# Altium project Main_Board.PrjPcb (part 24 of 44)

## Sheet TPS7A88_5V_Dual_3.3V_3.3V.SchDoc
size A4
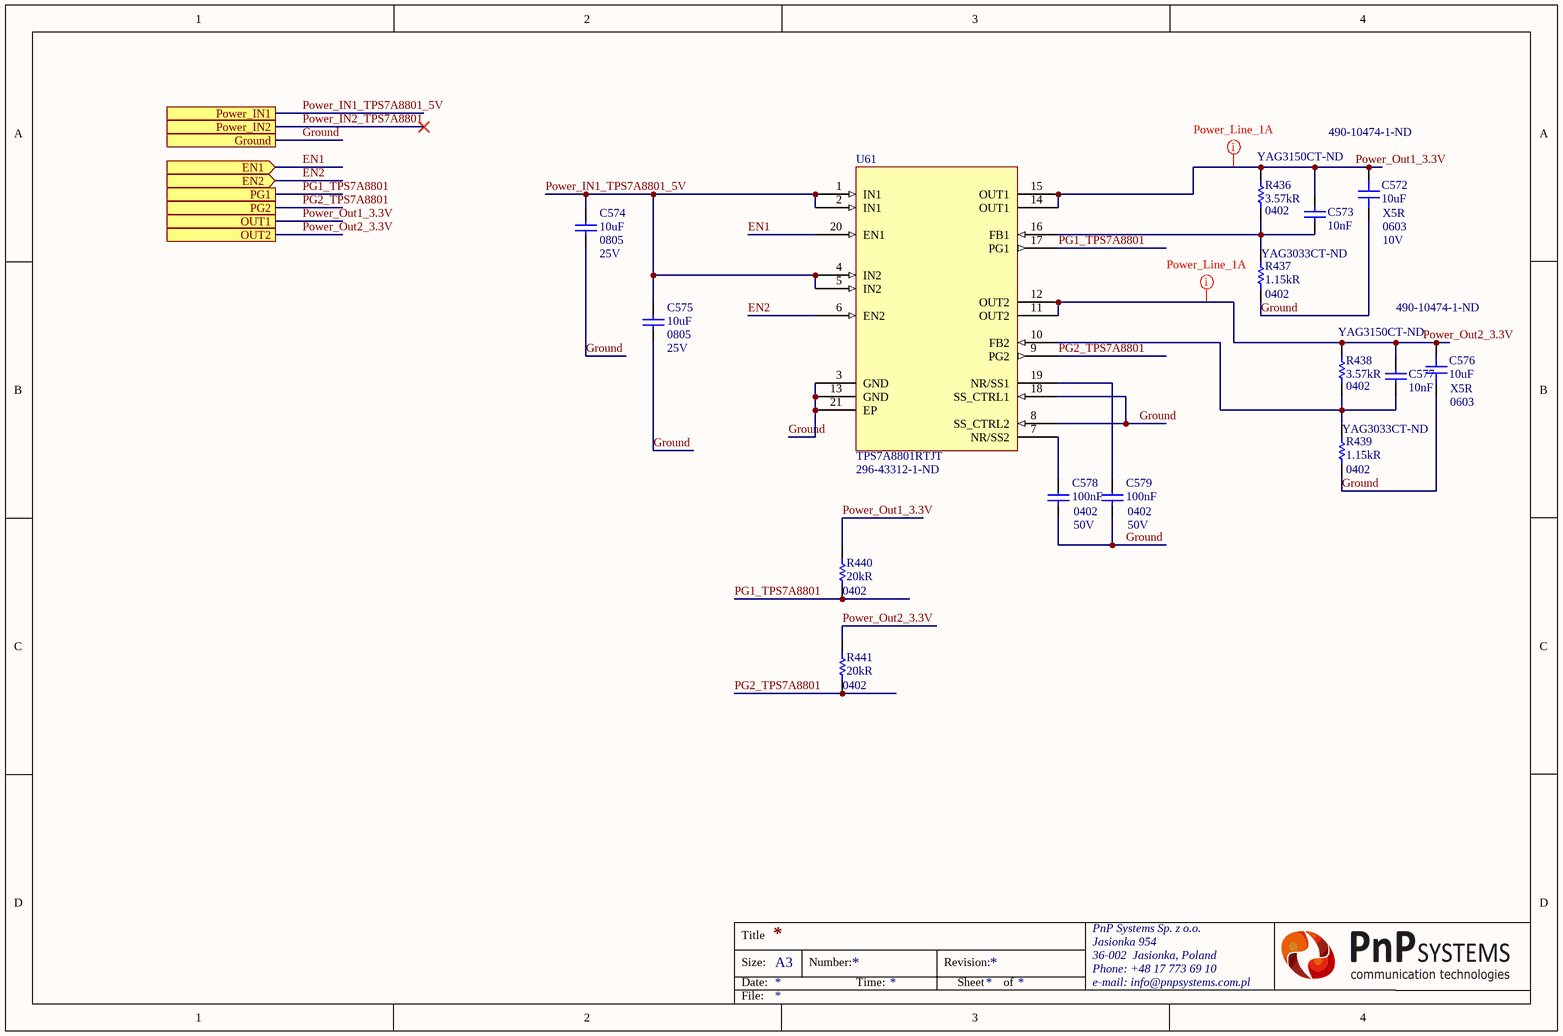
[diagram p32: TPS7A88_5V_Dual_3.3V_3.3V.SchDoc]

### Parts
C572  10uF  Supplier Part Number 1: 490-10474-1-ND  Case/Package: 0603  Dielectric: X5R  Voltage Rating: 10V  [CAP 0603/1608 RF]
C573  10nF  [CAP 0201/0603 KK]
C574  10uF  Case/Package: 0805  Voltage Rating: 25V  [CAP 0805/2012 RF]
C575  10uF  Case/Package: 0805  Voltage Rating: 25V  [CAP 0805/2012 RF]
C576  10uF  Supplier Part Number 1: 490-10474-1-ND  Case/Package: 0603  Dielectric: X5R  [CAP 0603/1608 RF]
C577  10nF  [CAP 0201/0603 KK]
C578  100nF  Case Code (Imperial): 0402  Voltage: 50V  [CAP 0402/1005 KK]
C579  100nF  Case Code (Imperial): 0402  Voltage: 50V  [CAP 0402/1005 KK]
R436  3.57kR  Supplier Part Number 1: YAG3150CT-ND  Case/Package: 0402  [RES 0402/1005 RF KK]
R437  1.15kR  Supplier Part Number 1: YAG3033CT-ND  Case/Package: 0402  [RES 0402/1005 RF KK]
R438  3.57kR  Supplier Part Number 1: YAG3150CT-ND  Case/Package: 0402  [RES 0402/1005 RF KK]
R439  1.15kR  Supplier Part Number 1: YAG3033CT-ND  Case/Package: 0402  [RES 0402/1005 RF KK]
R440  20kR  Case/Package: 0402  [RES 0402/1005 RF KK]
R441  20kR  Case/Package: 0402  [RES 0402/1005 RF KK]
U61  TPS7A8801RTJT  Supplier Part Number 1: 296-43312-1-ND  [TPS7A88]

### Ports
EN1 (in), EN2 (in), Ground, OUT1, OUT2, PG1, PG2, Power_IN1, Power_IN2

### Nets
EN1: U61.20(EN1) ; port EN1
EN2: U61.6(EN2) ; port EN2
Ground: C572.1 C574.1 C575.1 C576.1 C578.1 C579.1 R437.1 R439.1 U61.3(GND) U61.8(SS_CTRL2) U61.13(GND) U61.18(SS_CTRL1) U61.21(EP) ; port Ground
PG1_TPS7A8801: R440.2 U61.17(PG1) ; port PG1
PG2_TPS7A8801: R441.2 U61.9(PG2) ; port PG2
Power_IN1_TPS7A8801_5V: C574.2 C575.2 U61.1(IN1) U61.2(IN1) U61.4(IN2) U61.5(IN2) ; port Power_IN1  [project net 5V_RAIL]
Power_IN2_TPS7A8801: port Power_IN2
Power_Out1_3.3V: C572.2 C573.2 R436.2 R440.1 U61.14(OUT1) U61.15(OUT1) ; port OUT1  [project net Power_3.3_1]
Power_Out2_3.3V: C576.2 C577.2 R438.2 R441.1 U61.11(OUT2) U61.12(OUT2) ; port OUT2  [project net Power_3.3_2]
NetC573_1: C573.1 R436.1 R437.2 U61.16(FB1)
NetC577_1: C577.1 R438.1 R439.2 U61.10(FB2)
NetC578_2: C578.2 U61.7(NR/SS2)
NetC579_2: C579.2 U61.19(NR/SS1)

### Layout directives
net class Power_Line_1A: Power_3.3_1, Power_3.3_2

### Notes on the sheet
- Title
- Size:
- Date:
- A3
- Number:
- Time:
- Revision:
- Sheet
- of
- File:

### Library data of the parts
C572 = Capacitor: Manufacturer: Murata; Manufacturer Part Number: GRM188R61A106KE69D; Tolerance: 10%; Supplier 1: Digi-Key; Stock 1: 4597169; Pricing 1: 1 = 0,21000, 10 = 0,14000, 100 = 0,07110, 500 = 0,04864, 1000 = 0,04303 (USD); RoHS: Yes; Mount: Surface Mount; Case Code (Metric): 1608; Case Code (Imperial): 0603; Min Operating Temperature: -55°C; Max Operating Temperature: 85°C; Capacitance: 10uF; Packaging: Tape and Reel; Voltage: 10V; Voltage Rating (DC): 10V; Length: 1.6mm; Height: 0.8mm; Width: 0.031inch; Thickness: 0.037inch; Depth: 0.8mm; REACH SVHC: No SVHC; Lead Free: Lead Free; ComponentLink1URL: http://components.arrow.com/part/dataview/0323_07281717?src-supplier=Arrow+Europe; ComponentLink1Description: http://components.arrow.com/part/dataview/0323_07281717?src-supplier=Arrow+Europe; ComponentLink2URL: http://www.farnell.com/datasheets/1955682.pdf?src-supplier=Farnell; ComponentLink2Description: http://www.farnell.com/datasheets/1955682.pdf?src-supplier=Farnell; ComponentLink3URL: http://www.mouser.com/ds/2/281/c02e-2905.pdf?src-supplier=Mouser; ComponentLink3Description: http://www.mouser.com/ds/2/281/c02e-2905.pdf?src-supplier=Mouser; ComponentLink4URL: http://search.murata.co.jp/Ceramy/image/img/A01X/G101/ENG/GRM188R61A106KE69-01.pdf?src-supplier=Digi-Key; ComponentLink4Description: http://search.murata.co.jp/Ceramy/image/img/A01X/G101/ENG/GRM188R61A106KE69-01.pdf?src-supplier=Digi-Key; ComponentLink5URL: http://www.farnell.com/datasheets/1955682.pdf?src-supplier=Element14; ComponentLink5Description: http://www.farnell.com/datasheets/1955682.pdf?src-supplier=Element14; ComponentLink6URL: http://www.farnell.com/datasheets/1955682.pdf?src-supplier=Newark; ComponentLink6Description: http://www.farnell.com/datasheets/1955682.pdf?src-supplier=Newark; ComponentLink7URL: http://psearch.en.murata.com/capacitor/product/GRM188R61A106KE69%23.pdf?src-supplier=Avnet; ComponentLink7Description: http://psearch.en.murata.com/capacitor/product/GRM188R61A106KE69%23.pdf?src-supplier=Avnet
C573 C577 = Capacitor: as C624-C626 on sheet Power_Low_Curr; Supplier 1: Digi-Key; Supplier Part Number 1: 490-14453-1-ND; RoHS: No; Category: Ceramic Capacitors; Stock 1: 188777; Pricing 1: 1=0,10000, 10=0,01900, 100=0,00870, 500=0,00620, 1000=0,00487, 2500=0,00443, 5000=0,00407 (USD); Voltage Rating (DC): 16V; Dielectric: X7R; Capacitance: 10nF; Length: 600um; Width: 300um; Thickness: 300um; ComponentLink1URL: http://www.farnell.com/datasheets/2722745.pdf?src-supplier=Farnell; ComponentLink1Description: http://www.farnell.com/datasheets/2722745.pdf?src-supplier=Farnell; ComponentLink2URL: http://www.farnell.com/datasheets/2722745.pdf?src-supplier=Newark; ComponentLink2Description: http://www.farnell.com/datasheets/2722745.pdf?src-supplier=Newark; ComponentLink3URL: http://www.farnell.com/datasheets/2722745.pdf?src-supplier=Element14; ComponentLink3Description: http://www.farnell.com/datasheets/2722745.pdf?src-supplier=Element14; ComponentLink4URL: http://search.murata.co.jp/Ceramy/image/img/A01X/G101/ENG/GRM033R71C103KE14-01.pdf?src-supplier=Digi-Key; ComponentLink4Description: http://search.murata.co.jp/Ceramy/image/img/A01X/G101/ENG/GRM033R71C103KE14-01.pdf?src-supplier=Digi-Key
C574 C575 = Capacitor: as C581 on sheet LT3042_12V_5V_LNLDO; Supplier 1: Digi-Key; Supplier Part Number 1: 399-11939-6-ND; RoHS: Yes; Category: Ceramic Capacitors; Stock 1: 4800; Pricing 1: 1=0,24000, 10=0,16800, 100=0,09510, 500=0,06710, 1000=0,05872 (USD); Mount: Surface Mount; Case Code (Metric): 2012; Case Code (Imperial): 0805; Min Operating Temperature: -55°C; Max Operating Temperature: 85°C; Dielectric: X5R; Packaging: Cut Tape; Voltage: 25V; Termination: Solder; Tolerance: 10%; Voltage Rating (DC): 25V; Capacitance: 10uF; Length: 0.079inch; Height: 1.25mm; Depth: 1.25mm; Width: 0.049inch; Thickness: 0.057inch; REACH SVHC: No SVHC; Lead Free: Lead Free; ComponentLink1URL: http://www.farnell.com/datasheets/2741185.pdf?src-supplier=Farnell; ComponentLink1Description: http://www.farnell.com/datasheets/2741185.pdf?src-supplier=Farnell; ComponentLink2URL: http://www.farnell.com/datasheets/2112054.pdf?src-supplier=Farnell; ComponentLink2Description: http://www.farnell.com/datasheets/2112054.pdf?src-supplier=Farnell; ComponentLink3URL: http://www.alliedelec.com/m/d/f3c02ddb98afa3dd1adcb801109671e9.pdf?src-supplier=Allied+Electronics; ComponentLink3Description: http://www.alliedelec.com/m/d/f3c02ddb98afa3dd1adcb801109671e9.pdf?src-supplier=Allied+Electronics; ComponentLink4URL: http://www.farnell.com/datasheets/2112054.pdf?src-supplier=Element14; ComponentLink4Description: http://www.farnell.com/datasheets/2112054.pdf?src-supplier=Element14; ComponentLink5URL: https://api.kemet.com/component-edge/download/datasheet/C0805C106K3PAC7800.pdf?src-supplier=Digi-Key; ComponentLink5Description: https://api.kemet.com/component-edge/download/datasheet/C0805C106K3PAC7800.pdf?src-supplier=Digi-Key; ComponentLink6URL: http://www.kemet.com/docfinder?Partnumber=C0805C106K3PAC7800&src-supplier=Digi-Key; ComponentLink6Description: http://www.kemet.com/docfinder?Partnumber=C0805C106K3PAC7800&src-supplier=Digi-Key; ComponentLink7URL: http://www.kemet.com/Lists/ProductCatalog/Attachments/19/KEM_C1006_X5R_SMD.pdf?src-supplier=Avnet; ComponentLink7Description: http://www.kemet.com/Lists/ProductCatalog/Attachments/19/KEM_C1006_X5R_SMD.pdf?src-supplier=Avnet
C576 = Capacitor: Manufacturer: Murata; Manufacturer Part Number: GRM188R61A106KE69D; Tolerance: 10%; Voltage Rating: 10V; Supplier 1: Digi-Key; Stock 1: 4597169; Pricing 1: 1 = 0,21000, 10 = 0,14000, 100 = 0,07110, 500 = 0,04864, 1000 = 0,04303 (USD); RoHS: Yes; Mount: Surface Mount; Case Code (Metric): 1608; Case Code (Imperial): 0603; Min Operating Temperature: -55°C; Max Operating Temperature: 85°C; Capacitance: 10uF; Packaging: Tape and Reel; Voltage: 10V; Voltage Rating (DC): 10V; Length: 1.6mm; Height: 0.8mm; Width: 0.031inch; Thickness: 0.037inch; Depth: 0.8mm; REACH SVHC: No SVHC; Lead Free: Lead Free; ComponentLink1URL: http://components.arrow.com/part/dataview/0323_07281717?src-supplier=Arrow+Europe; ComponentLink1Description: http://components.arrow.com/part/dataview/0323_07281717?src-supplier=Arrow+Europe; ComponentLink2URL: http://www.farnell.com/datasheets/1955682.pdf?src-supplier=Farnell; ComponentLink2Description: http://www.farnell.com/datasheets/1955682.pdf?src-supplier=Farnell; ComponentLink3URL: http://www.mouser.com/ds/2/281/c02e-2905.pdf?src-supplier=Mouser; ComponentLink3Description: http://www.mouser.com/ds/2/281/c02e-2905.pdf?src-supplier=Mouser; ComponentLink4URL: http://search.murata.co.jp/Ceramy/image/img/A01X/G101/ENG/GRM188R61A106KE69-01.pdf?src-supplier=Digi-Key; ComponentLink4Description: http://search.murata.co.jp/Ceramy/image/img/A01X/G101/ENG/GRM188R61A106KE69-01.pdf?src-supplier=Digi-Key; ComponentLink5URL: http://www.farnell.com/datasheets/1955682.pdf?src-supplier=Element14; ComponentLink5Description: http://www.farnell.com/datasheets/1955682.pdf?src-supplier=Element14; ComponentLink6URL: http://www.farnell.com/datasheets/1955682.pdf?src-supplier=Newark; ComponentLink6Description: http://www.farnell.com/datasheets/1955682.pdf?src-supplier=Newark; ComponentLink7URL: http://psearch.en.murata.com/capacitor/product/GRM188R61A106KE69%23.pdf?src-supplier=Avnet; ComponentLink7Description: http://psearch.en.murata.com/capacitor/product/GRM188R61A106KE69%23.pdf?src-supplier=Avnet
C578 C579 = Capacitor: as C623 on sheet Power_Low_Curr; Supplier 1: Digi-Key; Supplier Part Number 1: 490-10697-1-ND; RoHS: Yes; Category: Ceramic Capacitors; Stock 1: 435607; Pricing 1: 1=0,10000, 10=0,04600, 100=0,02050, 500=0,01464, 1000=0,01150, 2500=0,01045, 5000=0,00961 (USD); Mount: Surface Mount; Case/Package: 0402; Weight: 0.000212oz; Case Code (Metric): 1005; Min Operating Temperature: -55°C; Max Operating Temperature: 85°C; Capacitance: 100nF; Packaging: Tape and Reel; Voltage Rating: 50V; Dielectric: X5R; Termination: SMD/SMT; Composition: Ceramic; Voltage Rating (DC): 50V; Package Quantity: 10000; Length: 1mm; Height: 0.5mm; Width: 0.02inch; Thickness: 0.022inch; Depth: 0.5mm; REACH SVHC: No SVHC; Lead Free: Lead Free; ComponentLink1URL: http://www.farnell.com/datasheets/2079150.pdf?src-supplier=Farnell; ComponentLink1Description: http://www.farnell.com/datasheets/2079150.pdf?src-supplier=Farnell; ComponentLink2URL: http://www.mouser.com/ds/2/281/c02e-2905.pdf?src-supplier=Mouser; ComponentLink2Description: http://www.mouser.com/ds/2/281/c02e-2905.pdf?src-supplier=Mouser; ComponentLink3URL: http://www.farnell.com/datasheets/2079150.pdf?src-supplier=Element14; ComponentLink3Description: http://www.farnell.com/datasheets/2079150.pdf?src-supplier=Element14; ComponentLink4URL: http://search.murata.co.jp/Ceramy/image/img/A01X/G101/ENG/GRM155R61H104KE14-01.pdf?src-supplier=Digi-Key; ComponentLink4Description: http://search.murata.co.jp/Ceramy/image/img/A01X/G101/ENG/GRM155R61H104KE14-01.pdf?src-supplier=Digi-Key
R436 R438 = Resistor: Thick Film Resistors - SMD 3.57K OHM 1%; Manufacturer: Yageo; Manufacturer Part Number: RC0402FR-073K57L; Power Rating: 62.5mW; Voltage Rating: 50V; Max Power Dissipation: 63mW; Temperature Coefficient: 100ppm/°C; Supplier 1: Digi-Key; RoHS: Yes; Category: Chip SMD Resistors; Stock 1: 898047; Pricing 1: 1=0,10000, 10=0,01600, 100=0,00640, 1000=0,00289, 2500=0,00251, 5000=0,00207 (USD); Case Code (Imperial): 0402; Case Code (Metric): 1005; Contact Plating: Tin,Matte; Min Operating Temperature: -55°C; Max Operating Temperature: 155°C; Tolerance: 1%; Packaging: Tape and Reel; Resistance: 3.57kR; Composition: Thick Film; Number of Terminations: 2; Termination: SMD/SMT; Military Standard: Not; Working Voltage: 50V; Features: Moisture Resistant; Length: 1mm; Height: 0.016inch; Width: 0.02inch; Depth: 0.5mm; Lead Free: Lead Free; ComponentLink1URL: https://datasheet.ciiva.com/16857/pyu-rc0402-51-rohs-l-6-16857623.pdf?src-supplier=Avnet+Europe; ComponentLink1Description: https://datasheet.ciiva.com/16857/pyu-rc0402-51-rohs-l-6-16857623.pdf?src-supplier=Avnet+Europe; ComponentLink2URL: https://datasheet.ciiva.com/8893/pyu-rc0402-51-rohs-l-6-8893597.pdf?src-supplier=Avnet; ComponentLink2Description: https://datasheet.ciiva.com/8893/pyu-rc0402-51-rohs-l-6-8893597.pdf?src-supplier=Avnet
R437 R439 = Resistor: Res General Purpose Thick Film 0402 1.15K Ohm 1% 1/16W ±100ppm/°C Molded SMD Paper T/R; Manufacturer: Yageo; Manufacturer Part Number: RC0402FR-071K15L; Power Rating: 62.5mW; Voltage Rating: 50V; Max Power Dissipation: 63mW; Supplier 1: Digi-Key; RoHS: Yes; Category: Chip SMD Resistors; Stock 1: 186720; Pricing 1: 1=0,10000, 10=0,01600, 100=0,00640, 1000=0,00289, 2500=0,00251, 5000=0,00207 (USD); Case Code (Imperial): 0402; Case Code (Metric): 1005; Contact Plating: Tin,Matte,Lead; Min Operating Temperature: -55°C; Max Operating Temperature: 155°C; Tolerance: 1%; Resistance: 1.15kR; Packaging: Tape and Reel; Composition: Thick Film; Number of Terminations: 2; Termination: SMD/SMT; Military Standard: Not; Temperature Coefficient: 100ppm/°C; Voltage Rating (DC): 50V; Features: Moisture Resistant; Length: 1mm; Height: 0.016inch; Width: 0.02inch; Depth: 0.5mm; Radiation Hardening: No; Lead Free: Lead Free; ComponentLink1URL: https://datasheet.ciiva.com/16856/pyu-rc0402-51-rohs-l-6-16856533.pdf?src-supplier=Avnet+Europe; ComponentLink1Description: https://datasheet.ciiva.com/16856/pyu-rc0402-51-rohs-l-6-16856533.pdf?src-supplier=Avnet+Europe; ComponentLink2URL: https://datasheet.ciiva.com/28418/pyu-rc0402-51-rohs-l-6-28418808.pdf?src-supplier=Avnet+Europe; ComponentLink2Description: https://datasheet.ciiva.com/28418/pyu-rc0402-51-rohs-l-6-28418808.pdf?src-supplier=Avnet+Europe; ComponentLink3URL: https://datasheet.ciiva.com/8895/pyu-rc0402-51-rohs-l-6-8895884.pdf?src-supplier=Avnet; ComponentLink3Description: https://datasheet.ciiva.com/8895/pyu-rc0402-51-rohs-l-6-8895884.pdf?src-supplier=Avnet; ComponentLink4URL: https://datasheet.ciiva.com/26829/getdatasheetpartid-326427-26829948.pdf?src-supplier=Verical; ComponentLink4Description: https://datasheet.ciiva.com/26829/getdatasheetpartid-326427-26829948.pdf?src-supplier=Verical
R440 R441 = Resistor: Manufacturer: Panasonic; Manufacturer Part Number: ERJ-2RKF2002X; Power Rating: 100mW; Tolerance: 1%; Voltage Rating: 50V; Temperature Coefficient: 100ppm/°C; Supplier 1: Digi-Key; Supplier Part Number 1: P20.0KLCT-ND; Stock 1: 2516725; Pricing 1: 1 = 0,10000, 10 = 0,05000, 100 = 0,02050, 1000 = 0,00920, 2500 = 0,00798, 5000 = 0,00660 (USD); RoHS: Yes; Mount: Surface Mount; Weight: 2.8E-05oz; Case Code (Metric): 1005; Case Code (Imperial): 0402; Contact Plating: Tin; Min Operating Temperature: -55°C; Max Operating Temperature: 155°C; Resistance: 20kR; Packaging: Cut Tape; Package Quantity: 1; Composition: Thick Film; Number of Terminations: 2; Termination: SMD/SMT; Military Standard: Not; Max Power Dissipation: 100mW; Voltage Rating (DC): 50V; Features: Automotive AEC-Q200; Length: 1mm; Height: 0.35mm; Width: 0.02inch; Depth: 0.5mm; Radiation Hardening: No; REACH SVHC: No SVHC; Lead Free: Lead Free; ComponentLink1URL: https://datasheet.ciiva.com/11821/0900766b80f80784-11821220.pdf?src-supplier=RSComponents; ComponentLink1Description: https://datasheet.ciiva.com/11821/0900766b80f80784-11821220.pdf?src-supplier=RSComponents; ComponentLink2URL: https://datasheet.ciiva.com/16762/70260748-16762885.pdf?src-supplier=Allied+Electronics; ComponentLink2Description: https://datasheet.ciiva.com/16762/70260748-16762885.pdf?src-supplier=Allied+Electronics; ComponentLink3URL: https://datasheet.ciiva.com/16782/70260748-16782455.pdf?src-supplier=Allied+Electronics; ComponentLink3Description: https://datasheet.ciiva.com/16782/70260748-16782455.pdf?src-supplier=Allied+Electronics; ComponentLink4URL: https://datasheet.ciiva.com/48531/aoa0000ce2-48531063.pdf?src-supplier=Avnet; ComponentLink4Description: https://datasheet.ciiva.com/48531/aoa0000ce2-48531063.pdf?src-supplier=Avnet; ComponentLink5URL: https://datasheet.ciiva.com/28688/1678782-28688600.pdf?src-supplier=Element14; ComponentLink5Description: https://datasheet.ciiva.com/28688/1678782-28688600.pdf?src-supplier=Element14; ComponentLink6URL: https://datasheet.ciiva.com/46377/426256-46377368.pdf?src-supplier=Element14; ComponentLink6Description: https://datasheet.ciiva.com/46377/426256-46377368.pdf?src-supplier=Element14; ComponentLink7URL: https://datasheet.ciiva.com/6138/426256-6138761.pdf?src-supplier=Farnell; ComponentLink7Description: https://datasheet.ciiva.com/6138/426256-6138761.pdf?src-supplier=Farnell; ComponentLink8URL: https://datasheet.ciiva.com/24159/aoa0000ce2-24159274.pdf?src-supplier=Mouser; ComponentLink8Description: https://datasheet.ciiva.com/24159/aoa0000ce2-24159274.pdf?src-supplier=Mouser; ComponentLink9URL: https://datasheet.ciiva.com/16508/aoa0000ce2-16508524.pdf?src-supplier=Future+Electronics; ComponentLink9Description: https://datasheet.ciiva.com/16508/aoa0000ce2-16508524.pdf?src-supplier=Future+Electronics; ComponentLink10URL: https://datasheet.ciiva.com/16514/aoa0000ce2-16514269.pdf?src-supplier=Avnet+Asia; ComponentLink10Description: https://datasheet.ciiva.com/16514/aoa0000ce2-16514269.pdf?src-supplier=Avnet+Asia; ComponentLink11URL: https://datasheet.ciiva.com/30049/aoa0000ce2-30049982.pdf?src-supplier=Onlinecomponents.com; ComponentLink11Description: https://datasheet.ciiva.com/30049/aoa0000ce2-30049982.pdf?src-supplier=Onlinecomponents.com
U61 = TPS7A8801RTJT: IC REG LINEAR POS ADJ 1A 20QFN; Manufacturer: Texas Instruments; Output Voltage: 5V; Number of Regulators: 2; Min Current Limit: 1.5A; Quiescent Current: 2mA; Dropout Voltage: 130mV; Supplier 1: Digi-Key; Manufacturer Part Number: TPS7A8801RTJT; RoHS: Yes; Category: Voltage References; Stock 1: 1455; Pricing 1: 1=2,77000, 10=2,48700, 25=2,34600, 100=1,87670 (USD); Mount: Surface Mount; Case/Package: QFN; Number of Pins: 20; Min Operating Temperature: -40°C; Max Operating Temperature: 125°C; Packaging: Tape and Reel; Output Current: 1A; Number of Outputs: 2; Lead Free: Lead Free; ComponentLink1URL: http://www.ti.com/lit/gpn/tps7a88?src-supplier=Mouser; ComponentLink1Description: http://www.ti.com/lit/gpn/tps7a88?src-supplier=Mouser; ComponentLink2URL: http://www.ti.com/lit/ds/symlink/tps7a88.pdf?src-supplier=Digi-Key; ComponentLink2Description: http://www.ti.com/lit/ds/symlink/tps7a88.pdf?src-supplier=Digi-Key; ComponentLink3URL: http://www.ti.com/general/docs/lit/getliterature.tsp?genericPartNumber=TPS7A88&amp;&amp;fileType=pdf&src-supplier=Farnell; ComponentLink3Description: http://www.ti.com/general/docs/lit/getliterature.tsp?genericPartNumber=TPS7A88&amp;&amp;fileType=pdf&src-supplier=Farnell

## Sheet I2C_Expander.SchDoc: I2C_Expander
size A3; Organization: Altium Limited; Address1: L3, 12a Rodborough Rd; Address2: Frenchs Forest; Address3: NSW; Address4: Australia 2086
Used 10 times, as channels PowerDistribition/Zasilanie CLK/I2C_Expander_PWR_CLK, PowerDistribition/I2C_Expander_PWR_Dist, Ext_GPIO/Ext_GPIO_Bank0/I2C_Expander_00, Ext_GPIO/Ext_GPIO_Bank0/I2C_Expander_01, Ext_GPIO/Ext_GPIO_Bank0/I2C_Expander_02, Ext_GPIO/Ext_GPIO_Bank1/I2C_Expander_10, Ext_GPIO/Ext_GPIO_Bank1/I2C_Expander_11, Ext_GPIO/Ext_GPIO_Bank1/I2C_Expander_12, SFP_Group+IMU/I2C_Expander_SFP, U_Expander_RESET/I2C_Expander_Main_Rst. Parts and nets are listed once, with the designators drawn on the sheet.
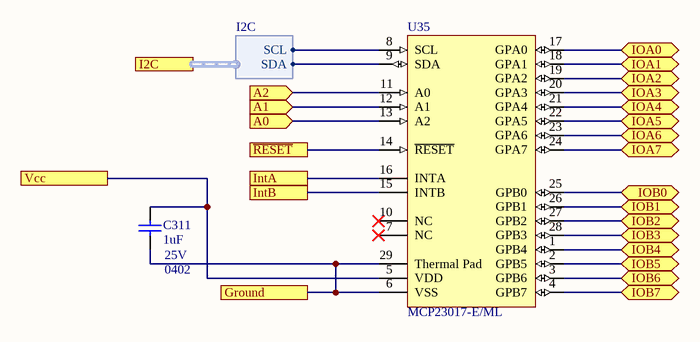
[diagram p33: I2C_Expander.SchDoc]

### Parts
C311  1uF  Case/Package: 0402  Voltage Rating: 25V  [CAP 0402/1005 KK]
U35  MCP23017-E/ML  [QFN-ML28_N]

### Ports
A0 (in), A1 (in), A2 (in), Ground, I2C (harness I2C), IntA, IntB, IOA0 (bidir), IOA1 (bidir), IOA2 (bidir), IOA3 (bidir), IOA4 (bidir), IOA5 (bidir), IOA6 (bidir), IOA7 (bidir), IOB0 (bidir), IOB1 (bidir), IOB2 (bidir), IOB3 (bidir), IOB4 (bidir), IOB5 (bidir), IOB6 (bidir), IOB7 (bidir), Vcc, ~{RESET}

### Harnesses
I2C: SCL, SDA

### Nets
A0: U35.13(A2) ; port A0
A1: U35.12(A1) ; port A1
A2: U35.11(A0) ; port A2
Ground: C311.1 U35.6(VSS) U35.29(Thermal_Pad) ; port Ground
IntA: U35.16(INTA) ; port IntA
IntB: U35.15(INTB) ; port IntB
IOA0: U35.17(GPA0) ; port IOA0
IOA1: U35.18(GPA1) ; port IOA1
IOA2: U35.19(GPA2) ; port IOA2
IOA3: U35.20(GPA3) ; port IOA3
IOA4: U35.21(GPA4) ; port IOA4
IOA5: U35.22(GPA5) ; port IOA5
IOA6: U35.23(GPA6) ; port IOA6
IOA7: U35.24(GPA7) ; port IOA7
IOB0: U35.25(GPB0) ; port IOB0
IOB1: U35.26(GPB1) ; port IOB1
IOB2: U35.27(GPB2) ; port IOB2
IOB3: U35.28(GPB3) ; port IOB3
IOB4: U35.1(GPB4) ; port IOB4
IOB5: U35.2(GPB5) ; port IOB5
IOB6: U35.3(GPB6) ; port IOB6
IOB7: U35.4(GPB7) ; port IOB7
~{RESET}: U35.14(~{RESET}) ; port ~{RESET}
Vcc: C311.2 U35.5(VDD) ; port Vcc
NetU35_8: U35.8(SCL) ; port I2C.SCL
NetU35_9: U35.9(SDA) ; port I2C.SDA

Not connected (* = marked no-connect by the designer): U35 7(NC)* 10(NC)*

### Channels
PowerDistribition/Zasilanie CLK/I2C_Expander_PWR_CLK: designators end in _I2C_Expander_PWR_CLK; ports A0=NetR738_2 A1=NetR740_2 A2=NetR742_2 Ground=B503_Ground IntA=PWR_ExtIO_INT3 IntB=PWR_ExtIO_INT2 IOA0=PG_PS_LTC6952_1 IOA1=EN_PS_LTC6952_1 IOA2=ADP1741_PG IOA3=ADP1741_EN IOA4=PG_PS_LTC6952_2 IOA5=EN_PS_LTC6952_2 IOA6=PG_PS_LTC6952_3 IOA7=EN_PS_LTC6952_3 IOB0=PG_LT3042 IOB1=EN1 IOB2=EN2 IOB3=PG1_TPS7A8801 IOB4=PG2_TPS7A8801 IOB5=NetU35_I2C_Expander_PWR_CLK_2 IOB6=NetU35_I2C_Expander_PWR_CLK_3 IOB7=NetU35_I2C_Expander_PWR_CLK_4 Vcc=3V3_RAIL ~{RESET}=NetR754_1
PowerDistribition/I2C_Expander_PWR_Dist: designators end in _I2C_Expander_PWR_Dist; ports A0=NetR455_2 A1=NetR458_2 A2=NetR462_2 Ground=B503_Ground IntA=PWR_ExtIO_INT0 IntB=PWR_ExtIO_INT1 IOA0=PWR_PowerAlert0 IOA1=PWR_PowerAlert1 IOA2=NetU35_I2C_Expander_PWR_Dist_19 IOA3=NetU35_I2C_Expander_PWR_Dist_20 IOA4=NetU35_I2C_Expander_PWR_Dist_21 IOA5=Power_MUX_Status0 IOA6=Power_MUX_Status1 IOA7=Power_MUX_Status2 IOB0=PG_3V3@14A_EXP IOB1=PG_5V@10A_EXP IOB2=PG_12@8A_EXP IOB3=PWR_Switch1_En IOB4=PWR_Switch1_Flag IOB5=PWR_Switch2_En IOB6=PWR_Switch2_Flag IOB7=PG_48_20V Vcc=3V3_RAIL ~{RESET}=PWR_ExtIO_nReset
Ext_GPIO/Ext_GPIO_Bank0/I2C_Expander_00: designators end in _I2C_Expander_00; ports A0=GPIO_Exp10_Adress0 A1=GPIO_Exp10_Adress1 A2=GPIO_Exp10_Adress2 Ground=B503_Ground IntA=GPIO_Exp10_Int0 IntB=GPIO_Exp10_Int1 IOA0=GPIOa_00.GPIO0 IOA1=GPIOa_00.GPIO1 IOA2=EN_PWR_PCIE_4 IOA3=GPIOa_00.GPIO3 IOA4=GPIOa_00.GPIO4 IOA5=GPIOa_00.GPIO5 IOA6=GPIOa_00.GPIO6 IOA7=GPIOa_00.GPIO7 IOB0=GPIOb_00.GPIO0 IOB1=GPIOb_00.GPIO1 IOB2=GPIOb_00.GPIO2 IOB3=D_05028_G4 IOB4=GPIOb_00.GPIO4 IOB5=GPIOb_00.GPIO5 IOB6=GPIOb_00.GPIO6 IOB7=GPIOb_00.GPIO7 Vcc=3V3_RAIL ~{RESET}=GPIO_Exp_Reset0
Ext_GPIO/Ext_GPIO_Bank0/I2C_Expander_01: designators end in _I2C_Expander_01; ports A0=GPIO_Exp11_Adress0 A1=GPIO_Exp11_Adress1 A2=GPIO_Exp11_Adress2 Ground=B503_Ground IntA=GPIO_Exp11_Int0 IntB=GPIO_Exp11_Int1 IOA0=GPIOa_01.GPIO0 IOA1=GPIOa_01.GPIO1 IOA2=GPIOa_01.GPIO2 IOA3=GPIOa_01.GPIO3 IOA4=GPIOa_01.GPIO4 IOA5=GPIOa_01.GPIO5 IOA6=GPIOa_01.GPIO6 IOA7=GPIOa_01.GPIO7 IOB0=GPIOb_01.GPIO0 IOB1=GPIOb_01.GPIO1 IOB2=GPIOb_01.GPIO2 IOB3=GPIOb_01.GPIO3 IOB4=GPIOb_01.GPIO4 IOB5=GPIOb_01.GPIO5 IOB6=eMMC_PG2 IOB7=eMMC_PG1 Vcc=3V3_RAIL ~{RESET}=GPIO_Exp_Reset0
Ext_GPIO/Ext_GPIO_Bank0/I2C_Expander_02: designators end in _I2C_Expander_02; ports A0=GPIO_Exp12_Adress0 A1=GPIO_Exp12_Adress1 A2=GPIO_Exp12_Adress2 Ground=B503_Ground IntA=GPIO_Exp12_Int0 IntB=GPIO_Exp12_Int1 IOA0=GPIOa_02.GPIO0 IOA1=GPIOa_02.GPIO1 IOA2=GPIOa_02.GPIO2 IOA3=GPIOa_02.GPIO3 IOA4=GPIOa_02.GPIO4 IOA5=GPIOa_02.GPIO5 IOA6=GPIOa_02.GPIO6 IOA7=EN_PWR_PCIE_3 IOB0=GPIOb_02.GPIO0 IOB1=GPIOb_02.GPIO1 IOB2=GPIOb_02.GPIO2 IOB3=GPIOb_02.GPIO3 IOB4=GPIOb_02.GPIO4 IOB5=GPIOb_02.GPIO5 IOB6=GPIOb_02.GPIO6 IOB7=GPIOb_02.GPIO7 Vcc=3V3_RAIL ~{RESET}=GPIO_Exp_Reset0
Ext_GPIO/Ext_GPIO_Bank1/I2C_Expander_10: designators end in _I2C_Expander_10; ports A0=GPIO_Exp13_Adress0 A1=GPIO_Exp13_Adress1 A2=GPIO_Exp13_Adress2 Ground=B503_Ground IntA=GPIO_Exp13_Int0 IntB=GPIO_Exp13_Int1 IOA0=En_PWRSwitch_PCIE2 IOA1=GPIOa_10.GPIO1 IOA2=GPIOa_10.GPIO2 IOA3=GPIOa_10.GPIO3 IOA4=GPIOa_10.GPIO4 IOA5=GPIOa_10.GPIO5 IOA6=GPIOa_10.GPIO6 IOA7=GPIOa_10.GPIO7 IOB0=GPIOb_10.GPIO0 IOB1=GPIOb_10.GPIO1 IOB2=En_PWRSwitch_PCIE0 IOB3=GPIOb_10.GPIO3 IOB4=GPIOb_10.GPIO4 IOB5=GPIO_ETH_EXPANDER IOB6=GPIOb_10.GPIO6 IOB7=EN_SPI_Q2 Vcc=3V3_RAIL ~{RESET}=GPIO_Exp_Reset1
Ext_GPIO/Ext_GPIO_Bank1/I2C_Expander_11: designators end in _I2C_Expander_11; ports A0=GPIO_Exp14_Adress0 A1=GPIO_Exp14_Adress1 A2=GPIO_Exp14_Adress2 Ground=B503_Ground IntA=GPIO_Exp14_Int0 IntB=GPIO_Exp14_Int1 IOA0=EN_SPI_Q1 IOA1=GPIOa_11.GPIO1 IOA2=En_PWRSwitch_PCIE1 IOA3=EN_SPI_Q0_MAIN IOA4=GPIOa_11.GPIO4 IOA5=EN_SPI_Q1_MAIN IOA6=GPIOa_11.GPIO6 IOA7=GPIOa_11.GPIO7 IOB0=EN_SPI_Q4 IOB1=GPIOb_11.GPIO1 IOB2=GPIOb_11.GPIO2 IOB3=EN_SPI_Q4_MAIN IOB4=GPIOb_11.GPIO4 IOB5=GPIOb_11.GPIO5 IOB6=GPIOb_11.GPIO6 IOB7=Charge_CAP Vcc=3V3_RAIL ~{RESET}=GPIO_Exp_Reset1
Ext_GPIO/Ext_GPIO_Bank1/I2C_Expander_12: designators end in _I2C_Expander_12; ports A0=GPIO_Exp15_Adress0 A1=GPIO_Exp15_Adress1 A2=GPIO_Exp15_Adress2 Ground=B503_Ground IntA=GPIO_Exp15_Int0 IntB=GPIO_Exp15_Int1 IOA0=FTDI_JTAG_ON_1 IOA1=FTDI_JTAG_ON_2 IOA2=FTDI_JTAG_ON_3 IOA3=FTDI_JTAG_ON_4 IOA4=D_05028_G6 IOA5=D_05028_G5 IOA6=D_05028_S1 IOA7=D_05028_S0 IOB0=D_05028_G3 IOB1=GPIOb_12.GPIO1 IOB2=GPIOb_12.GPIO2 IOB3=GPIOb_12.GPIO3 IOB4=GPIOb_12.GPIO4 IOB5=GPIOb_12.GPIO5 IOB6=EN_Detect IOB7=GPIOb_12.GPIO7 Vcc=3V3_RAIL ~{RESET}=GPIO_Exp_Reset1
SFP_Group+IMU/I2C_Expander_SFP: designators end in _I2C_Expander_SFP; ports A0=NetR475_2 A1=NetR477_2 A2=NetR479_2 Ground=B503_Ground IntA=SFP_INT0 IntB=SFP_INT1 IOA0=SFP3_TxF IOA1=SFP3_TxDis IOA2=SFP3_LOS IOA3=NetU35_I2C_Expander_SFP_20 IOA4=NetU35_I2C_Expander_SFP_21 IOA5=SFP1_TxF IOA6=SFP1_TxDis IOA7=SFP1_LOS IOB0=SFP2_TxF IOB1=SFP2_TxDis IOB2=SFP2_LOS IOB3=NetU35_I2C_Expander_SFP_28 IOB4=NetU35_I2C_Expander_SFP_1 IOB5=SFP0_TxF IOB6=SFP0_TxDis IOB7=SFP0_LOS Vcc=3V3_RAIL ~{RESET}=SFP_IO_nReset
U_Expander_RESET/I2C_Expander_Main_Rst: designators end in _I2C_Expander_Main_Rst; ports A0=NetR758_2 A1=NetR760_2 A2=NetR762_2 Ground=B503_Ground IntA=INTA_EXP_MAIN IntB=INTB_EXP_MAIN IOA0=GPIO_Exp_Reset0 IOA1=GPIO_Exp_Reset1 IOA2=GPIO_Exp_Reset2 IOA3=NetR749_1 IOA4=NetR750_1 IOA5=NetR751_1 IOA6=NetR752_1 IOA7=NetU35_I2C_Expander_Main_Rst_24 IOB0=NetR753_1 IOB1=NetR754_1 IOB2=PWR_ExtIO_nReset IOB3=SFP_IO_nReset IOB4=RST_brigde IOB5=Enable_CLK IOB6=NetSP12_I2C_Bridge_GPIO_1 IOB7=NetU35_I2C_Expander_Main_Rst_4 Vcc=3V3_RAIL ~{RESET}=MainExpReset

### Notes on the sheet
- Title
- Size:
- Date:
- A3
- Number:
- Time:
- Revision:
- Sheet
- of
- File:

### Library data of the parts
C311 = Capacitor: as C604 on sheet Power_Low_Curr; Supplier 1: Digi-Key; Supplier Part Number 1: 490-12263-1-ND; Manufacturer: Murata; Manufacturer Part Number: GRT155R61E105KE01D; RoHS: Yes; Category: Ceramic Capacitors; Stock 1: 341453; Pricing 1: 1=0,18000, 10=0,12300, 100=0,06210, 500=0,04248, 1000=0,03758, 2500=0,03594, 5000=0,03268 (USD); Mount: Surface Mount; Case Code (Metric): 1005; Case Code (Imperial): 0402; Min Operating Temperature: -55°C; Max Operating Temperature: 85°C; Packaging: Tape and Reel; Capacitance: 1uF; Tolerance: 10%; Dielectric: X5R; Voltage Rating (DC): 25V; Length: 0.039inch; Width: 0.02inch; Thickness: 0.022inch; Ratings: AEC-Q200; ComponentLink1URL: http://www.farnell.com/datasheets/2165918.pdf?src-supplier=Farnell; ComponentLink1Description: http://www.farnell.com/datasheets/2165918.pdf?src-supplier=Farnell; ComponentLink2URL: http://search.murata.co.jp/Ceramy/image/img/A01X/G101/ENG/GRT155R61E105KE01-01.pdf?src-supplier=Digi-Key; ComponentLink2Description: http://search.murata.co.jp/Ceramy/image/img/A01X/G101/ENG/GRT155R61E105KE01-01.pdf?src-supplier=Digi-Key; ComponentLink3URL: http://www.farnell.com/datasheets/2165918.pdf?src-supplier=Element14; ComponentLink3Description: http://www.farnell.com/datasheets/2165918.pdf?src-supplier=Element14
U35 = MCP23017-E/ML: 16-Bit I/O Expander with Serial Interface, 28-Pin QFN, Extended Temperature; Manufacturer: Microchip; DatasheetVersion: revB, Feb-2007; PackageVersion: revBB, Aug-2009; PackageReference: QFN-ML28; PackageDescription: 28-Lead Plastic Quad Flat, No Lead Package (ML) - 6x6 mm Body [QFN] with 0.55 mm Contact Length; Supplier 1: Digi-Key; Supplier Part Number 1: MCP23017-E/ML-ND; Supplier 2: Newark; Supplier Part Number 2: 31K2957; Supplier 3: Mouser; Supplier Part Number 3: 579-MCP23017-E/ML; Mounting Technology: Surface Mount; Code_JEDEC: MO-220; PartNumber: MCP23017-E/ML; ComponentLink1Description: Manufacturer URL; ComponentLink1URL: http://www.microchip.com/; ComponentLink2Description: Datasheet; ComponentLink2URL: http://ww1.microchip.com/downloads/en/DeviceDoc/21952b.pdf; ComponentLink3Description: Package Specification; ComponentLink3URL: http://www.microchip.com/stellent/groups/techpub_sg/documents/packagingspec/en012702.pdf